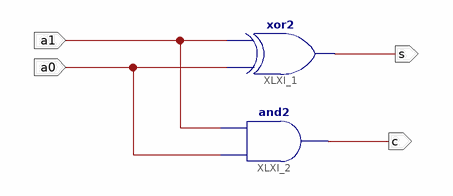
[diagram p0: schematic sheet 1]
// Xilinx ISE schematic lab_1.sch (spartan3) as structural Verilog: 2 symbols, 4 ports
module lab_1 (
  input  a0,
  input  a1,
  output s,
  output c
);

  xor XLXI_1 (s, a0, a1);
  and XLXI_2 (c, a0, a1);
endmodule
